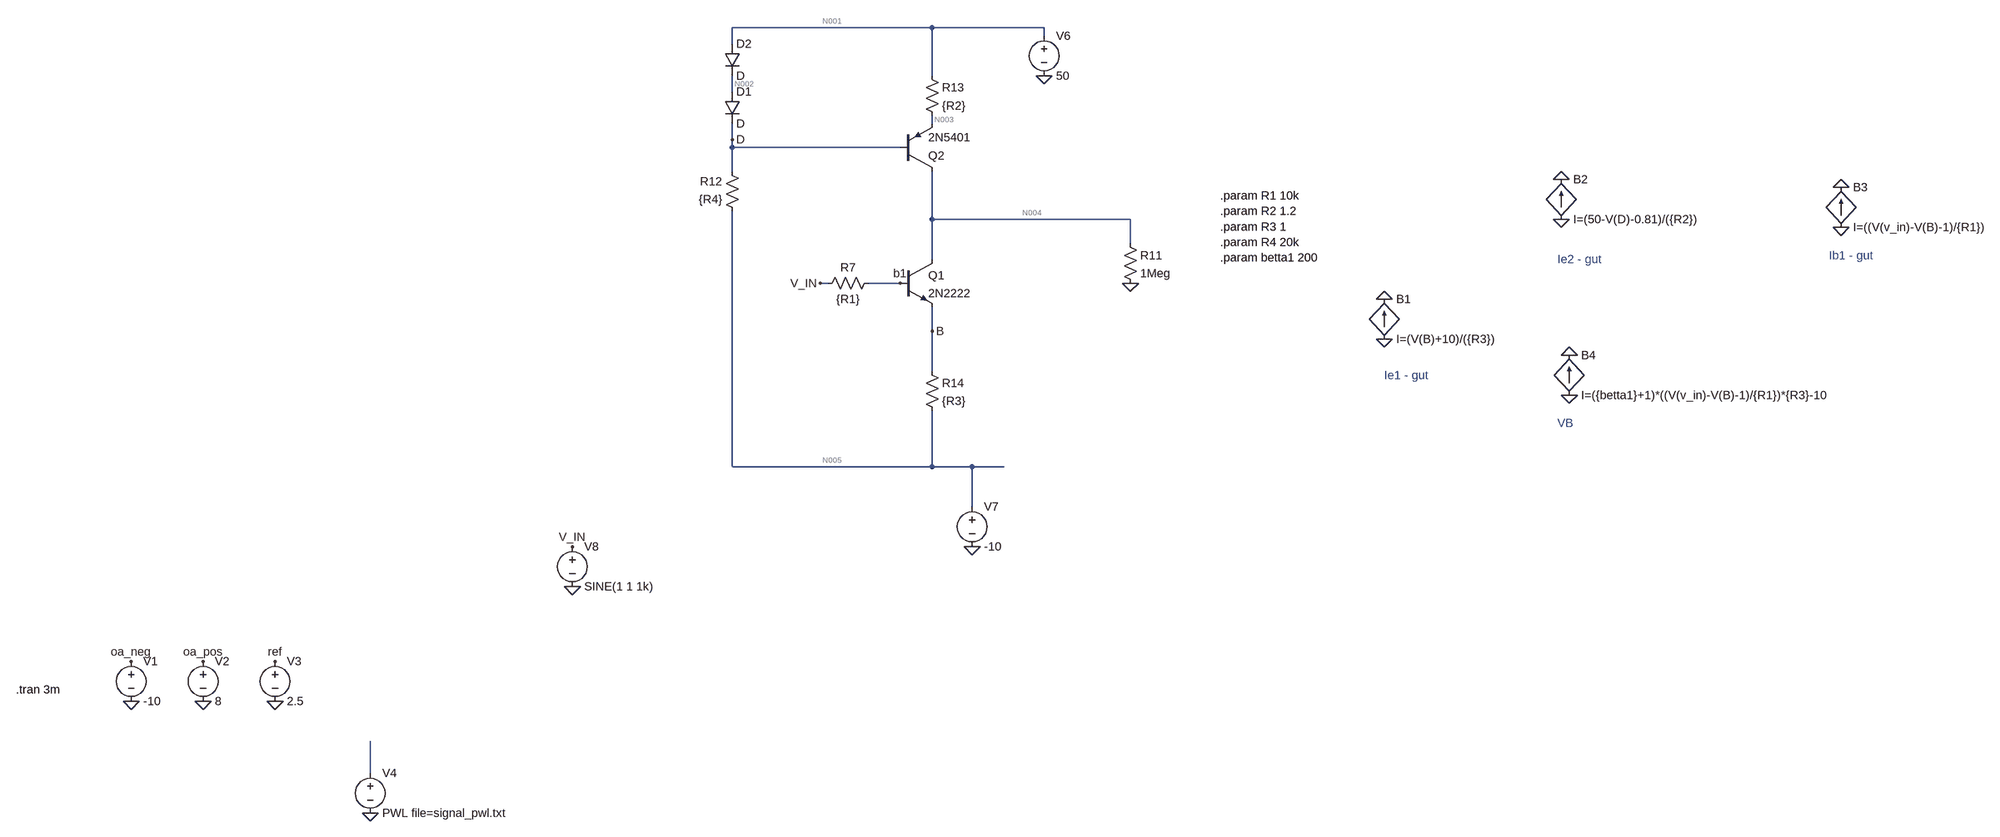
[diagram p0: schematic Draft2.asc]
* Draft2.asc
V1 oa_neg 0 -10
V2 oa_pos 0 8
V3 ref 0 2.5
R12 N005 D {R4}
D1 N002 D D
D2 N001 N002 D
Q1 N004 b1 B 0 2N2222
R13 N001 N003 {R2}
V6 N001 0 50
Q2 N004 D N003 0 2N5401
R14 B N005 {R3}
V7 N005 0 -10
V4 N006 0 PWL file=signal_pwl.txt
R7 b1 V_IN {R1}
V8 V_IN 0 SINE(1 1 1k)
B1 0 0 I=(V(B)+10)/({R3})
B2 0 0 I=(50-V(D)-0.81)/({R2})
R11 N004 0 1Meg
B3 0 0 I=((V(v_in)-V(B)-1)/{R1})
B4 0 0 I=({betta1}+1)*((V(v_in)-V(B)-1)/{R1})*{R3}-10
.model D D
.lib standard.dio
.model NPN NPN
.model PNP PNP
.lib standard.bjt
.tran 3m
.param R1 10k
.param R2 1.2
.param R3 1
.param R4 20k
.param betta1 200
* Ib1 - gut
* Ie2 - gut
* Ie1 - gut
* VB
.backanno
.end

* Results of the author's LTspice run, read from the files saved beside the schematic
* Operating Point, zero values left out:
*   V(b) = -9.796 V
*   V(b1) = -8.953 V
*   V(d) = 48.93 V
*   V(n001) = 50 V
*   V(n002) = 49.47 V
*   V(n003) = 49.75 V
*   V(n004) = 39.82 V
*   V(n005) = -10 V
*   V(oa_neg) = -10 V
*   V(oa_pos) = 8 V
*   V(ref) = 2.5 V
*   V(v_in) = 1 V
*   I(B1) = 204.3 mA
*   I(B2) = 213.1 mA
*   I(B3) = 979.6 µA
*   I(B4) = -9.803 A
*   I(D1) = 8.849 µA
*   I(D2) = 8.849 µA
*   I(R11) = 39.82 µA
*   I(R12) = -2.947 mA
*   I(R13) = 206.3 mA
*   I(R14) = 204.3 mA
*   I(R7) = -995.3 µA
*   I(V6) = -206.3 mA
*   I(V7) = 207.3 mA
*   I(V8) = -995.3 µA
*   Ib(Q1) = 995.3 µA
*   Ib(Q2) = -2.938 mA
*   Ic(Q1) = 203.4 mA
*   Ic(Q2) = -203.4 mA
*   Ie(Q1) = -204.3 mA
*   Ie(Q2) = 206.3 mA
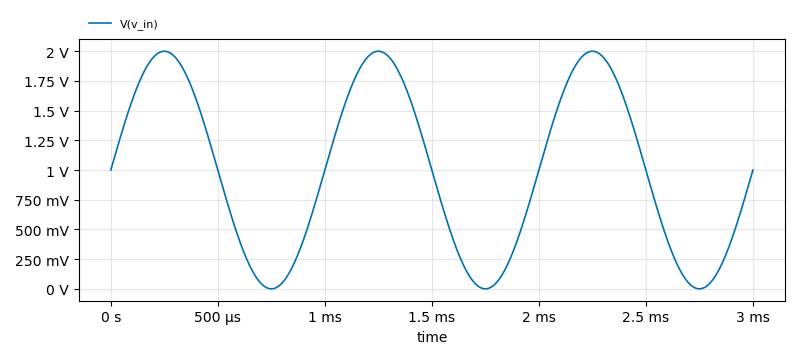
[diagram p1: Transient Analysis of Draft2.asc, plotted from the saved traces]
* Transient Analysis, 1 run:
*   V(v_in): min 609.9 nV, max 2 V, average 1 V, rms 1.225 V, last 1 V